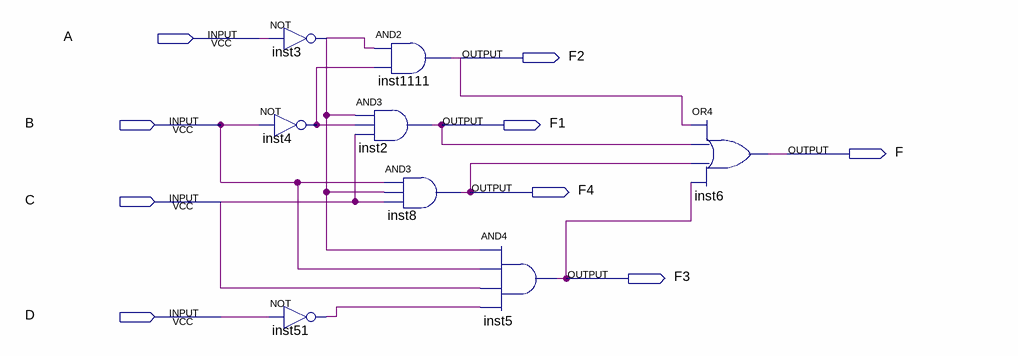
[diagram p0: schematic sheet]
// Quartus schematic EX3.bdf as structural Verilog: 8 symbols, 9 pins
module EX3 (
  input  A,
  input  B,
  input  C,
  input  D,
  output F2,
  output F1,
  output F,
  output F4,
  output F3
);

  wire inst3_out, inst4_out, inst51_out;

  not inst3 (inst3_out, A);
  not inst4 (inst4_out, B);
  not inst51 (inst51_out, D);
  and inst1111 (F2, inst3_out, inst4_out);
  and inst2 (F1, inst3_out, inst4_out, C);
  and inst8 (F4, B, inst3_out, C);
  and inst5 (F3, inst3_out, B, C, inst51_out);
  or inst6 (F, F2, F1, F4, F3);
endmodule
